# Altium schematic sheet 7-Segment-Sheet.SchDoc
size 420 x 297 mm; SheetNumber: 2; SheetTotal: 2
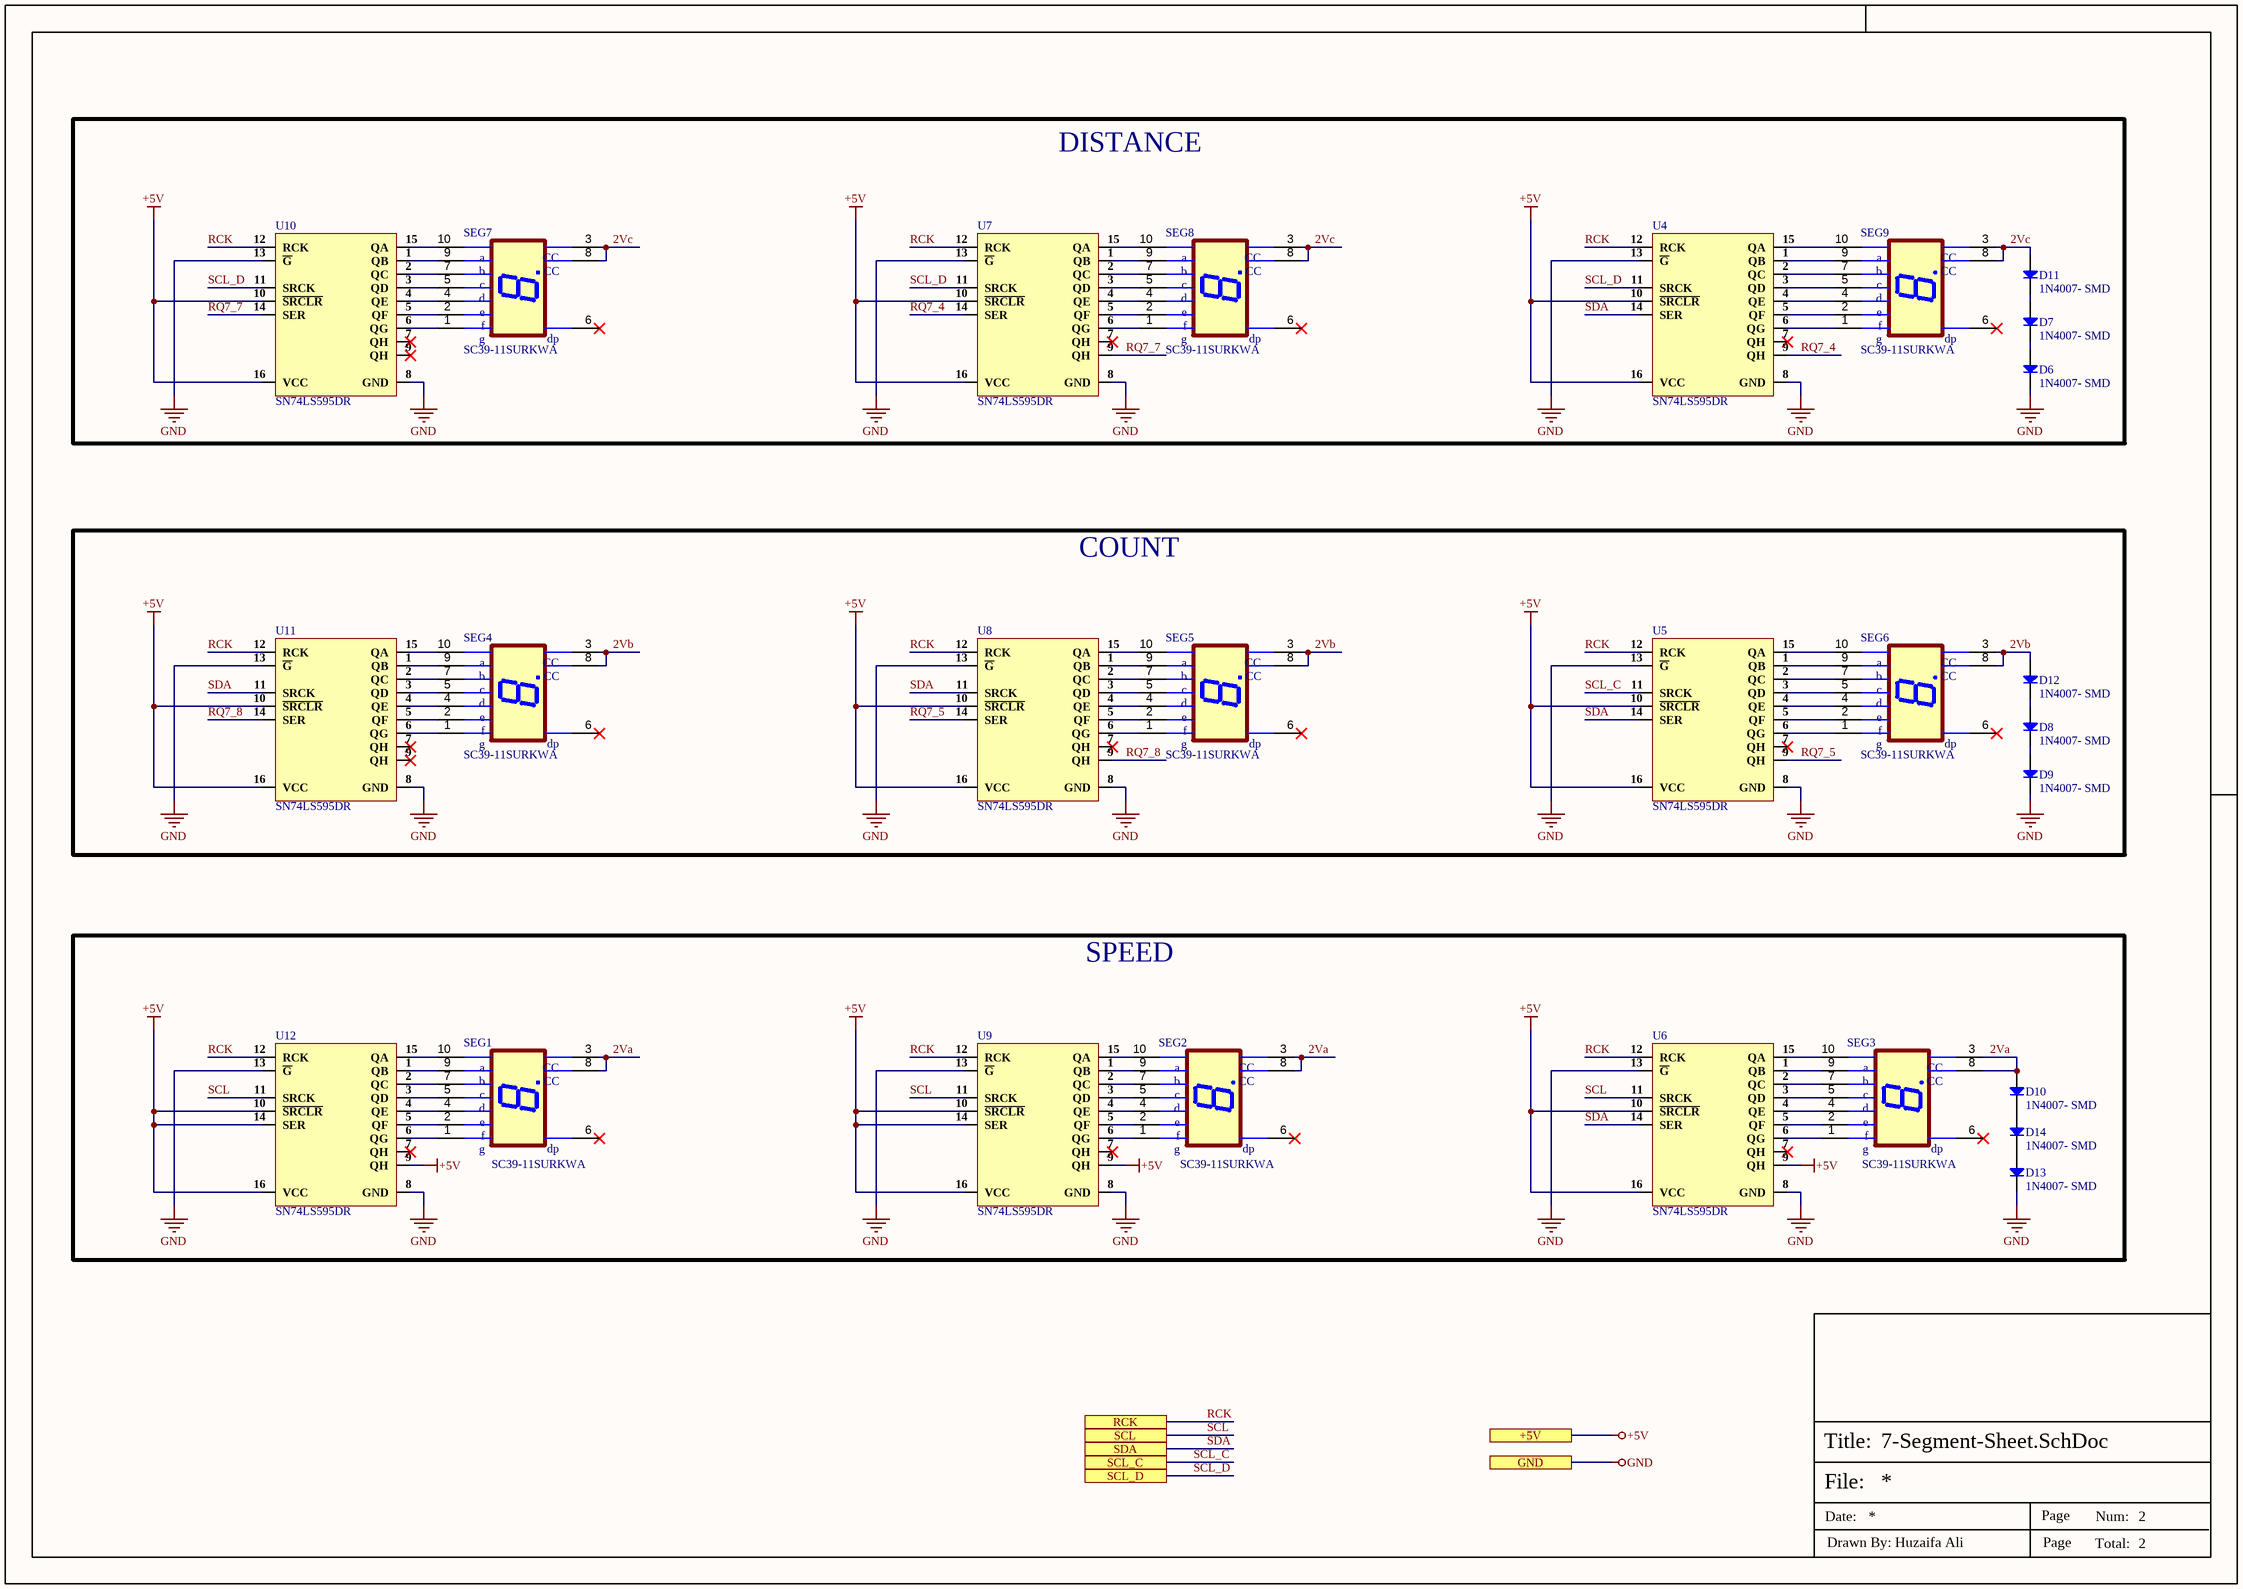
[diagram p0: 7-Segment-Sheet.SchDoc]

## Parts
D6  1N4007- SMD  [SMA(DO-214AC)]
D7  1N4007- SMD  [SMA(DO-214AC)]
D8  1N4007- SMD  [SMA(DO-214AC)]
D9  1N4007- SMD  [SMA(DO-214AC)]
D10  1N4007- SMD  [SMA(DO-214AC)]
D11  1N4007- SMD  [SMA(DO-214AC)]
D12  1N4007- SMD  [SMA(DO-214AC)]
D13  1N4007- SMD  [SMA(DO-214AC)]
D14  1N4007- SMD  [SMA(DO-214AC)]
SEG1  SC39-11SURKWA  [SC39-11SURKWA]
SEG2  SC39-11SURKWA  [SC39-11SURKWA]
SEG3  SC39-11SURKWA  [SC39-11SURKWA]
SEG4  SC39-11SURKWA  [SC39-11SURKWA]
SEG5  SC39-11SURKWA  [SC39-11SURKWA]
SEG6  SC39-11SURKWA  [SC39-11SURKWA]
SEG7  SC39-11SURKWA  [SC39-11SURKWA]
SEG8  SC39-11SURKWA  [SC39-11SURKWA]
SEG9  SC39-11SURKWA  [SC39-11SURKWA]
U4  SN74LS595DR  [16-SOIC (0.154", 3.90mm Width)]
U5  SN74LS595DR  [16-SOIC (0.154", 3.90mm Width)]
U6  SN74LS595DR  [16-SOIC (0.154", 3.90mm Width)]
U7  SN74LS595DR  [16-SOIC (0.154", 3.90mm Width)]
U8  SN74LS595DR  [16-SOIC (0.154", 3.90mm Width)]
U9  SN74LS595DR  [16-SOIC (0.154", 3.90mm Width)]
U10  SN74LS595DR  [16-SOIC (0.154", 3.90mm Width)]
U11  SN74LS595DR  [16-SOIC (0.154", 3.90mm Width)]
U12  SN74LS595DR  [16-SOIC (0.154", 3.90mm Width)]

## Blocks framed on the sheet
DISTANCE: D6 D7 D11 SEG7-SEG9 U4 U7 U10
COUNT: D8 D9 D12 SEG4-SEG6 U5 U8 U11
SPEED: D10 D13 D14 SEG1-SEG3 U6 U9 U12

## Ports
+5V (see Controller-Sheet[5D]), GND (see Controller-Sheet[5D]), RCK (see Controller-Sheet[4D]), SCL (see Controller-Sheet[4D]), SCL_C (see Controller-Sheet[4D]), SCL_D (see Controller-Sheet[4D]), SDA (see Controller-Sheet[4D])

## Nets
+5V: U4.10(~{SRCLR}) U4.16(VCC) U5.10(~{SRCLR}) U5.16(VCC) U6.9(QH) U6.10(~{SRCLR}) U6.16(VCC) U7.10(~{SRCLR}) U7.16(VCC) U8.10(~{SRCLR}) U8.16(VCC) U9.9(QH) U9.10(~{SRCLR}) U9.14(SER) U9.16(VCC) U10.10(~{SRCLR}) U10.16(VCC) U11.10(~{SRCLR}) U11.16(VCC) U12.9(QH) U12.10(~{SRCLR}) U12.14(SER) U12.16(VCC) ; port +5V
GND: D6.1(K) D9.1(K) D13.1(K) U4.8(GND) U4.13(~{G}) U5.8(GND) U5.13(~{G}) U6.8(GND) U6.13(~{G}) U7.8(GND) U7.13(~{G}) U8.8(GND) U8.13(~{G}) U9.8(GND) U9.13(~{G}) U10.8(GND) U10.13(~{G}) U11.8(GND) U11.13(~{G}) U12.8(GND) U12.13(~{G}) ; port GND
2Va: D10.2(A) SEG1.3(CC@1) SEG1.8(CC) SEG2.3(CC@1) SEG2.8(CC) SEG3.3(CC@1) SEG3.8(CC)
2Vb: D12.2(A) SEG4.3(CC@1) SEG4.8(CC) SEG5.3(CC@1) SEG5.8(CC) SEG6.3(CC@1) SEG6.8(CC)
2Vc: D11.2(A) SEG7.3(CC@1) SEG7.8(CC) SEG8.3(CC@1) SEG8.8(CC) SEG9.3(CC@1) SEG9.8(CC)
RCK: U4.12(RCK) U5.12(RCK) U6.12(RCK) U7.12(RCK) U8.12(RCK) U9.12(RCK) U10.12(RCK) U11.12(RCK) U12.12(RCK) ; port RCK
RQ7_4: U4.9(QH) U7.14(SER)
RQ7_5: U5.9(QH) U8.14(SER)
RQ7_7: U7.9(QH) U10.14(SER)
RQ7_8: U8.9(QH) U11.14(SER)
SCL: U6.11(SRCK) U9.11(SRCK) U12.11(SRCK) ; port SCL
SCL_C: U5.11(SRCK) ; port SCL_C
SCL_D: U4.11(SRCK) U7.11(SRCK) U10.11(SRCK) ; port SCL_D
SDA: U4.14(SER) U5.14(SER) U6.14(SER) U8.11(SRCK) U11.11(SRCK) ; port SDA
NetD6_2: D6.2(A) D7.1(K)
NetD7_2: D7.2(A) D11.1(K)
NetD8_1: D8.1(K) D9.2(A)
NetD8_2: D8.2(A) D12.1(K)
NetD10_1: D10.1(K) D14.2(A)
NetD13_2: D13.2(A) D14.1(K)
NetSEG1_1: SEG1.1(G) U12.6(QG)
NetSEG1_2: SEG1.2(F) U12.5(QF)
NetSEG1_4: SEG1.4(E) U12.4(QE)
NetSEG1_5: SEG1.5(D) U12.3(QD)
NetSEG1_7: SEG1.7(C) U12.2(QC)
NetSEG1_9: SEG1.9(B) U12.1(QB)
NetSEG1_10: SEG1.10(A) U12.15(QA)
NetSEG2_1: SEG2.1(G) U9.6(QG)
NetSEG2_2: SEG2.2(F) U9.5(QF)
NetSEG2_4: SEG2.4(E) U9.4(QE)
NetSEG2_5: SEG2.5(D) U9.3(QD)
NetSEG2_7: SEG2.7(C) U9.2(QC)
NetSEG2_9: SEG2.9(B) U9.1(QB)
NetSEG2_10: SEG2.10(A) U9.15(QA)
NetSEG3_1: SEG3.1(G) U6.6(QG)
NetSEG3_2: SEG3.2(F) U6.5(QF)
NetSEG3_4: SEG3.4(E) U6.4(QE)
NetSEG3_5: SEG3.5(D) U6.3(QD)
NetSEG3_7: SEG3.7(C) U6.2(QC)
NetSEG3_9: SEG3.9(B) U6.1(QB)
NetSEG3_10: SEG3.10(A) U6.15(QA)
NetSEG4_1: SEG4.1(G) U11.6(QG)
NetSEG4_2: SEG4.2(F) U11.5(QF)
NetSEG4_4: SEG4.4(E) U11.4(QE)
NetSEG4_5: SEG4.5(D) U11.3(QD)
NetSEG4_7: SEG4.7(C) U11.2(QC)
NetSEG4_9: SEG4.9(B) U11.1(QB)
NetSEG4_10: SEG4.10(A) U11.15(QA)
NetSEG5_1: SEG5.1(G) U8.6(QG)
NetSEG5_2: SEG5.2(F) U8.5(QF)
NetSEG5_4: SEG5.4(E) U8.4(QE)
NetSEG5_5: SEG5.5(D) U8.3(QD)
NetSEG5_7: SEG5.7(C) U8.2(QC)
NetSEG5_9: SEG5.9(B) U8.1(QB)
NetSEG5_10: SEG5.10(A) U8.15(QA)
NetSEG6_1: SEG6.1(G) U5.6(QG)
NetSEG6_2: SEG6.2(F) U5.5(QF)
NetSEG6_4: SEG6.4(E) U5.4(QE)
NetSEG6_5: SEG6.5(D) U5.3(QD)
NetSEG6_7: SEG6.7(C) U5.2(QC)
NetSEG6_9: SEG6.9(B) U5.1(QB)
NetSEG6_10: SEG6.10(A) U5.15(QA)
NetSEG7_1: SEG7.1(G) U10.6(QG)
NetSEG7_2: SEG7.2(F) U10.5(QF)
NetSEG7_4: SEG7.4(E) U10.4(QE)
NetSEG7_5: SEG7.5(D) U10.3(QD)
NetSEG7_7: SEG7.7(C) U10.2(QC)
NetSEG7_9: SEG7.9(B) U10.1(QB)
NetSEG7_10: SEG7.10(A) U10.15(QA)
NetSEG8_1: SEG8.1(G) U7.6(QG)
NetSEG8_2: SEG8.2(F) U7.5(QF)
NetSEG8_4: SEG8.4(E) U7.4(QE)
NetSEG8_5: SEG8.5(D) U7.3(QD)
NetSEG8_7: SEG8.7(C) U7.2(QC)
NetSEG8_9: SEG8.9(B) U7.1(QB)
NetSEG8_10: SEG8.10(A) U7.15(QA)
NetSEG9_1: SEG9.1(G) U4.6(QG)
NetSEG9_2: SEG9.2(F) U4.5(QF)
NetSEG9_4: SEG9.4(E) U4.4(QE)
NetSEG9_5: SEG9.5(D) U4.3(QD)
NetSEG9_7: SEG9.7(C) U4.2(QC)
NetSEG9_9: SEG9.9(B) U4.1(QB)
NetSEG9_10: SEG9.10(A) U4.15(QA)

Not connected (* = marked no-connect by the designer): SEG1 6(DP)*; SEG2 6(DP)*; SEG3 6(DP)*; SEG4 6(DP)*; SEG5 6(DP)*; SEG6 6(DP)*; SEG7 6(DP)*; SEG8 6(DP)*; SEG9 6(DP)*; U4 7(QH)*; U5 7(QH)*; U6 7(QH)*; U7 7(QH)*; U8 7(QH)*; U9 7(QH)*; U10 7(QH)* 9(QH)*; U11 7(QH)* 9(QH)*; U12 7(QH)*

## Notes on the sheet
- File:
- Title:
- Date:
- Page
- Num:
- Total:
- Drawn By: Huzaifa Ali
- (in symbol SC39-11SURKWA) a; b; c; d; e; f; g; dp

## Library data of the parts
D6-D14 = 1N4007- SMD: 1A Single 1kV 1.1V@1A SMA(DO-214AC) Diodes - General Purpose ROHS; Manufacturer: TWGMC; Manufacturer Part Number: 1N4007; Item Type: Diode; Package: SMA(DO-214AC); LCSC Part Number: C727081; ComponentLink1Description: LCSC; ComponentLink1URL: https://www.lcsc.com/product-detail/Diodes-General-Purpose_TWGMC-1N4007_C727081.html
SEG1-SEG9 = SC39-11SURKWA: DISPLAY 7SEG 0.39" SGL RED 10DIP; Manufacturer: Kingbright; Item Type: LED Displays; Supplier: Digikey; Supplier Part Number: SC39-11SURKWA-ND; Manufacturer Part Number: SC39-11SURKWA; RoHS: Yes; Stock: 3214; Pricing: 1=1.86, 39=1.23821, 117=0.95282, 507=0.86132, 1014=0.74021, 2028=0.69983, 5031=0.68368, 10023=0.67291 (USD); ComponentLink1URL: https://datasheet.ciiva.com/26291/sc39-11surkwa-26291740.pdf?src-supplier=Digikey; ComponentLink1Description: https://datasheet.ciiva.com/26291/sc39-11surkwa-26291740.pdf?src-supplier=Digikey; ComponentLink2URL: https://datasheet.ciiva.com/16375/sc39-11surkwa-246106-16375578.pdf?src-supplier=Mouser; ComponentLink2Description: https://datasheet.ciiva.com/16375/sc39-11surkwa-246106-16375578.pdf?src-supplier=Mouser; ComponentLink3URL: https://datasheet.ciiva.com/1317/1519922-1317612.pdf?src-supplier=Newark; ComponentLink3Description: https://datasheet.ciiva.com/1317/1519922-1317612.pdf?src-supplier=Newark; ComponentLink4URL: https://datasheet.ciiva.com/29367/001050548-da-01-en-led-anzeige-7-seg-rot-sc39-11surkwa-29367379.pdf?src-supplier=Conrad; ComponentLink4Description: https://datasheet.ciiva.com/29367/001050548-da-01-en-led-anzeige-7-seg-rot-sc39-11surkwa-29367379.pdf?src-supplier=Conrad; ComponentLink5URL: https://datasheet.ciiva.com/1535/1519922-1535149.pdf?src-supplier=Element14; ComponentLink5Description: https://datasheet.ciiva.com/1535/1519922-1535149.pdf?src-supplier=Element14
U4-U12 = SN74LS595DR: IC 8BIT SHFT REG OUT LTCH 16SOIC; Manufacturer: Texas Instruments; Supplier: Mouser; Supplier Part Number: 595-SN74LS595DR; Manufacturer Part Number: SN74LS595DR; RoHS: Yes; Item Type: IC; Stock: 2196; Pricing: 1=11.61, 10=10.48, 50=10, 100=8.68, 1000=6.58, 10000=6.34 (USD); ComponentLink1URL: https://datasheet.ciiva.com/14296/sn74ls595-14296811.pdf?src-supplier=Avnet; ComponentLink1Description: https://datasheet.ciiva.com/14296/sn74ls595-14296811.pdf?src-supplier=Avnet; ComponentLink2URL: https://datasheet.ciiva.com/1886/sn74ls595-1886573.pdf?src-supplier=Digikey; ComponentLink2Description: https://datasheet.ciiva.com/1886/sn74ls595-1886573.pdf?src-supplier=Digikey; ComponentLink3URL: https://datasheet.ciiva.com/1886/sn74ls595-1886574.pdf?src-supplier=Digikey; ComponentLink3Description: https://datasheet.ciiva.com/1886/sn74ls595-1886574.pdf?src-supplier=Digikey; ComponentLink4URL: https://datasheet.ciiva.com/1886/sn74ls595-1886575.pdf?src-supplier=Digikey; ComponentLink4Description: https://datasheet.ciiva.com/1886/sn74ls595-1886575.pdf?src-supplier=Digikey